# Altium schematic sheet PCB-MAIN_08_STORAGE_SENSORS.SchDoc
size 594 x 420 mm
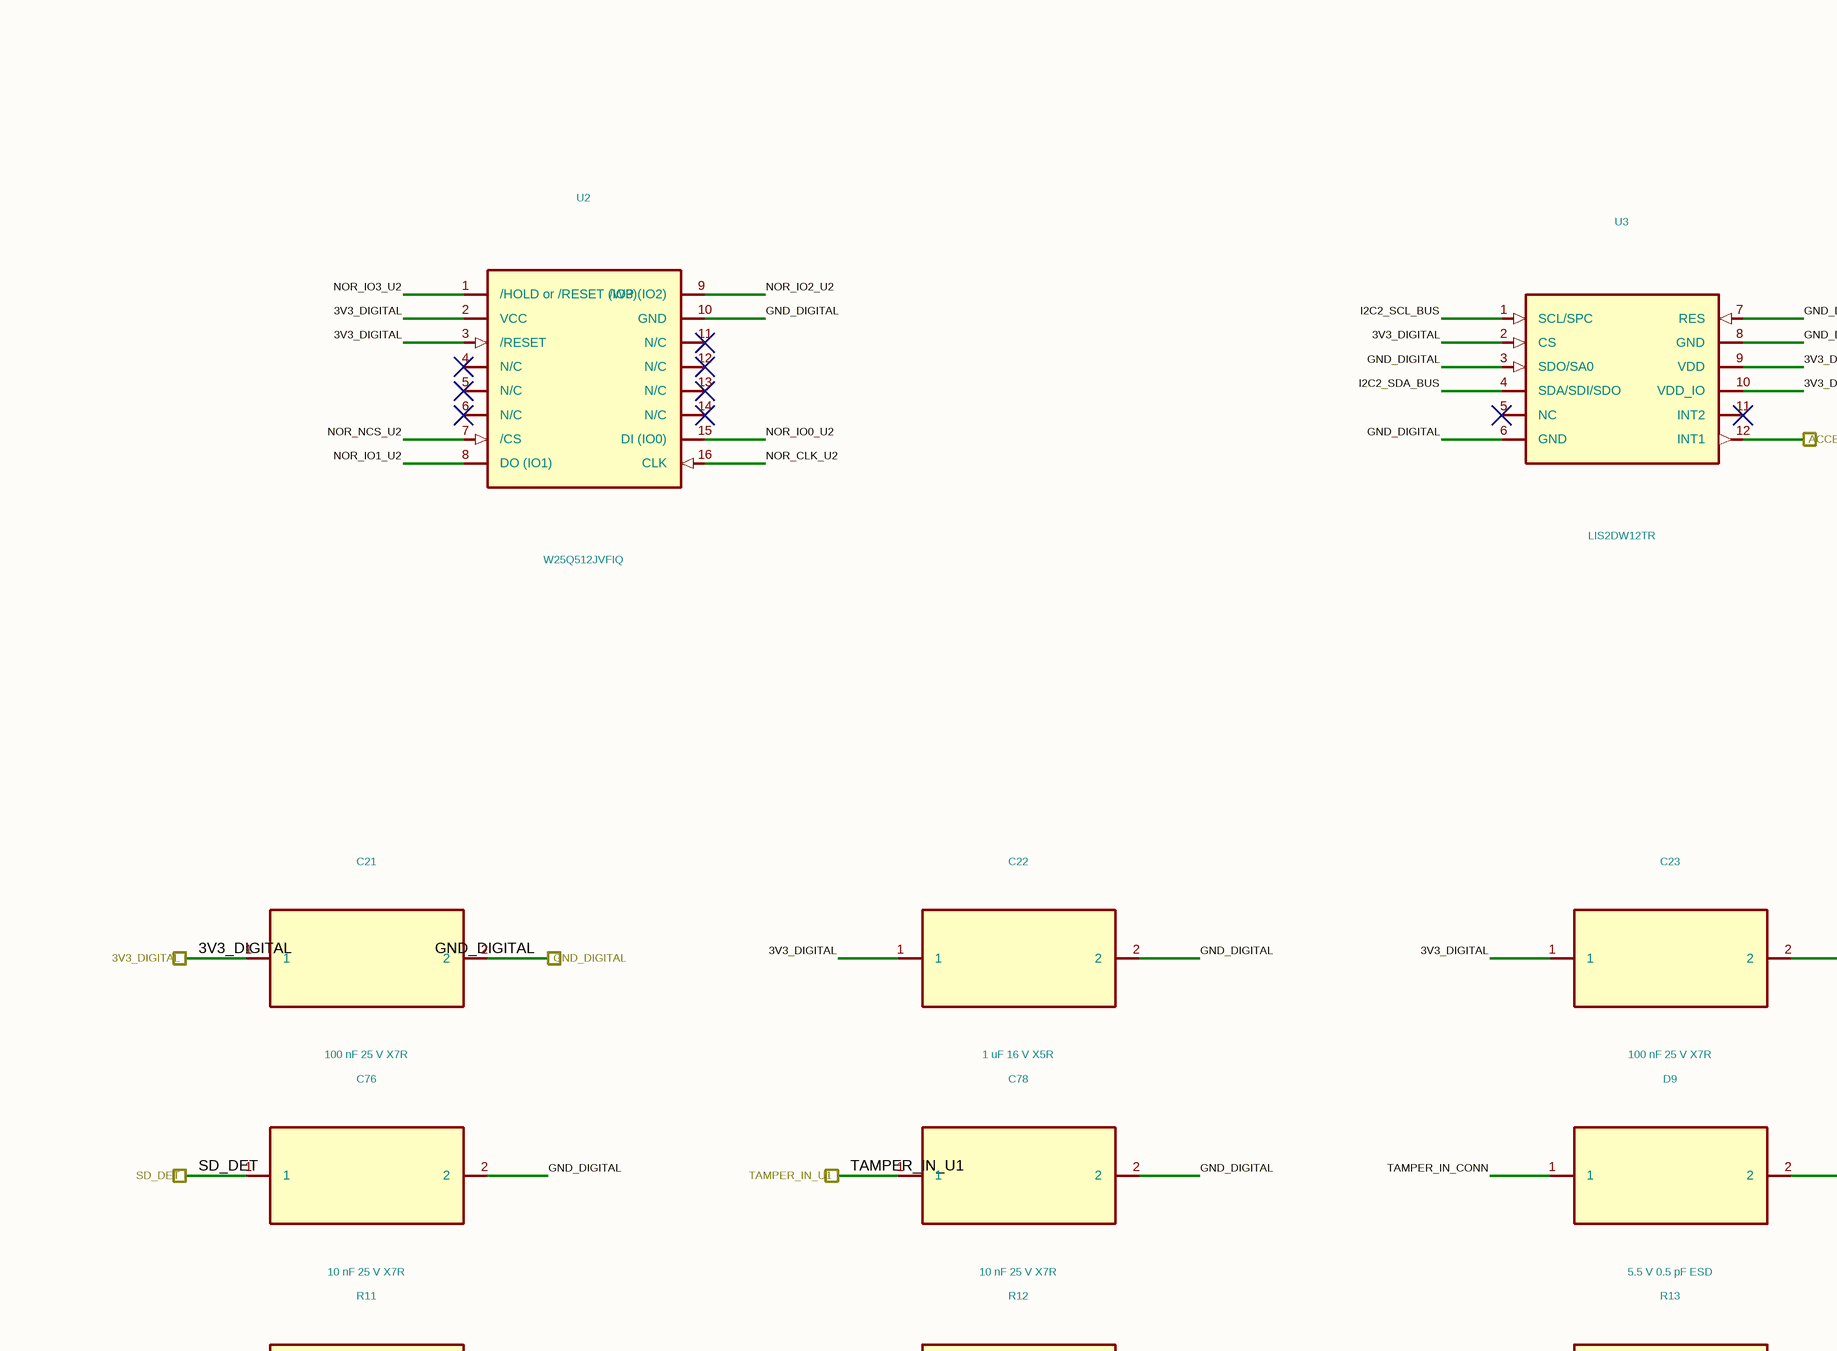
[diagram p0: PCB-MAIN_08_STORAGE_SENSORS.SchDoc, top left]
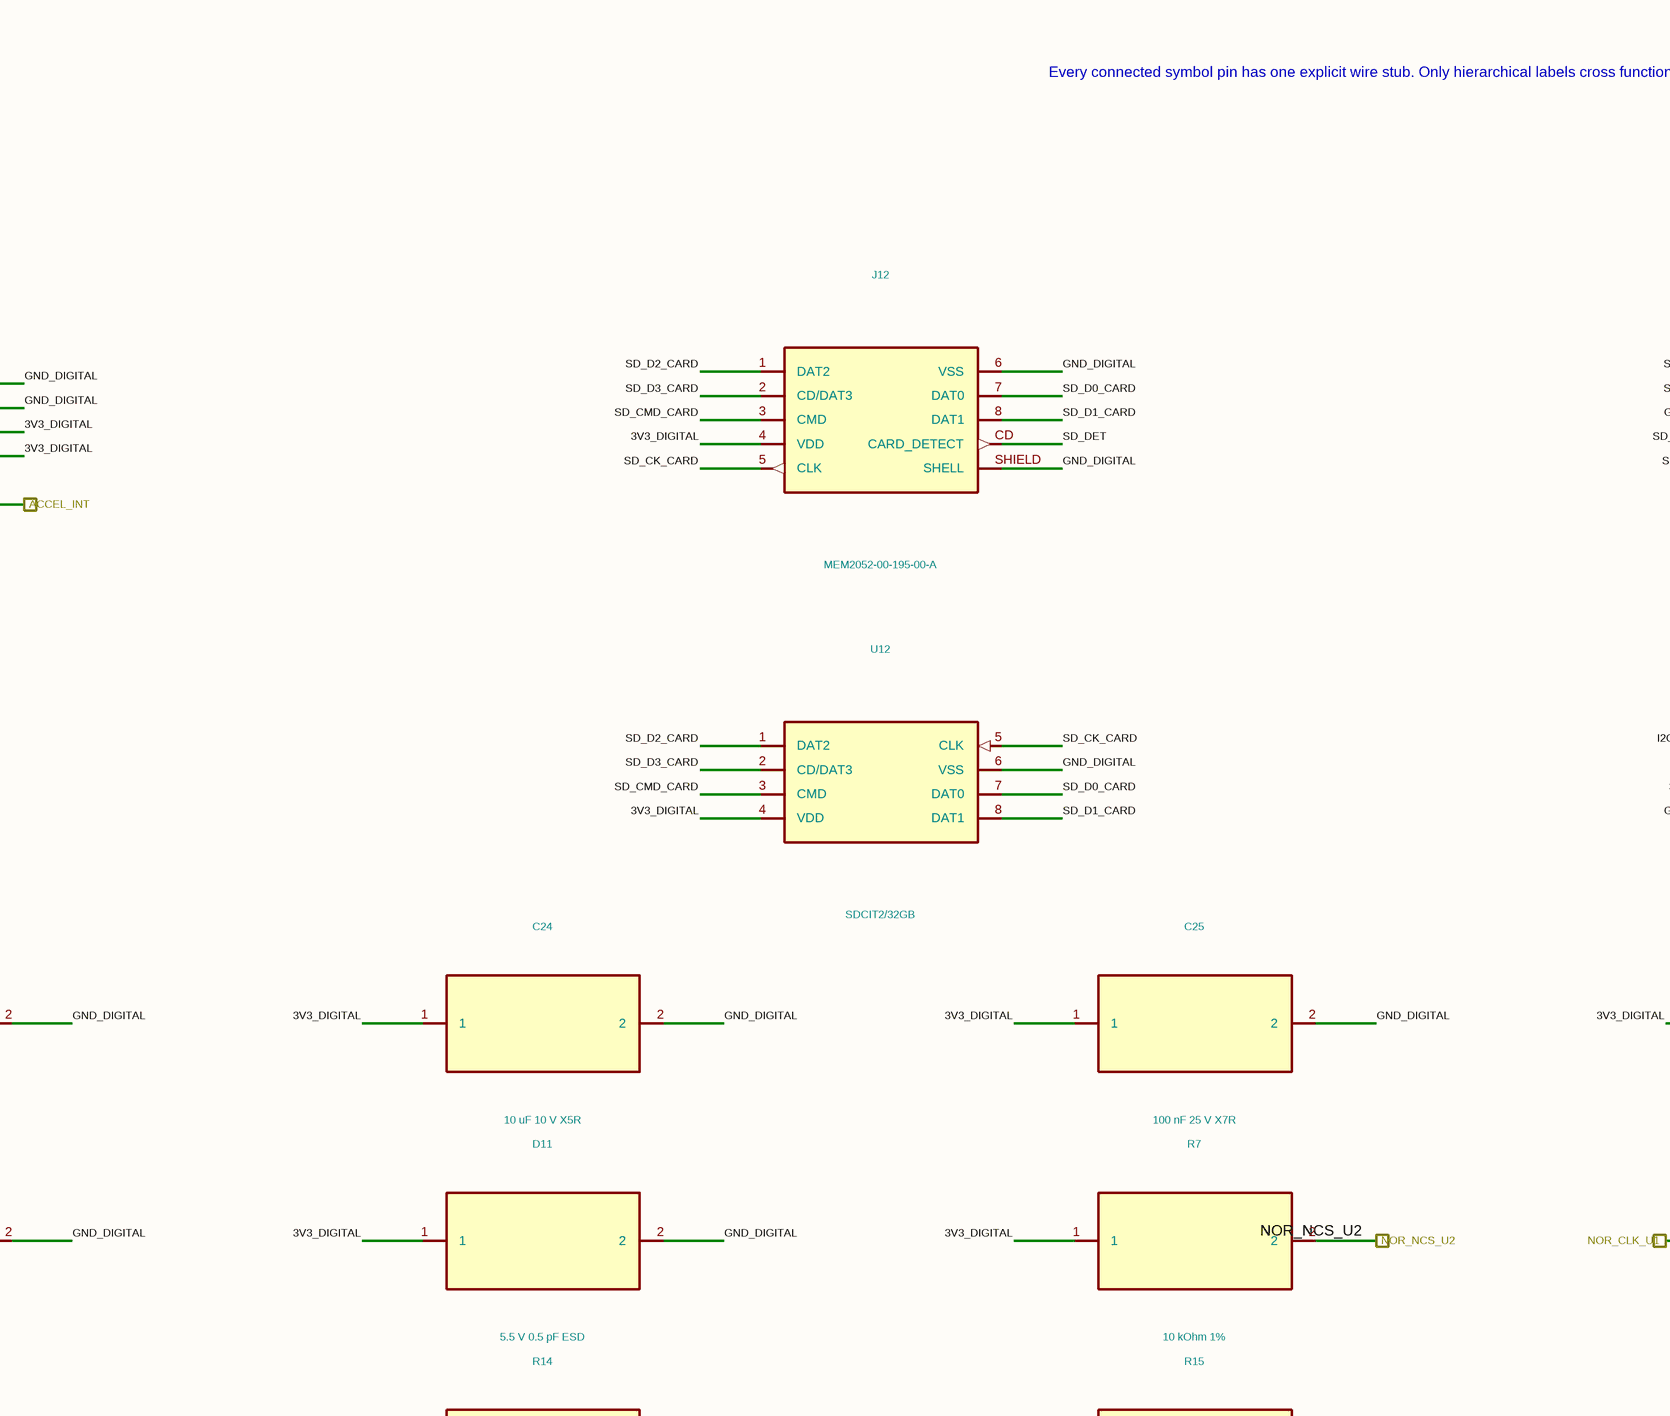
[diagram p1: PCB-MAIN_08_STORAGE_SENSORS.SchDoc, top middle]
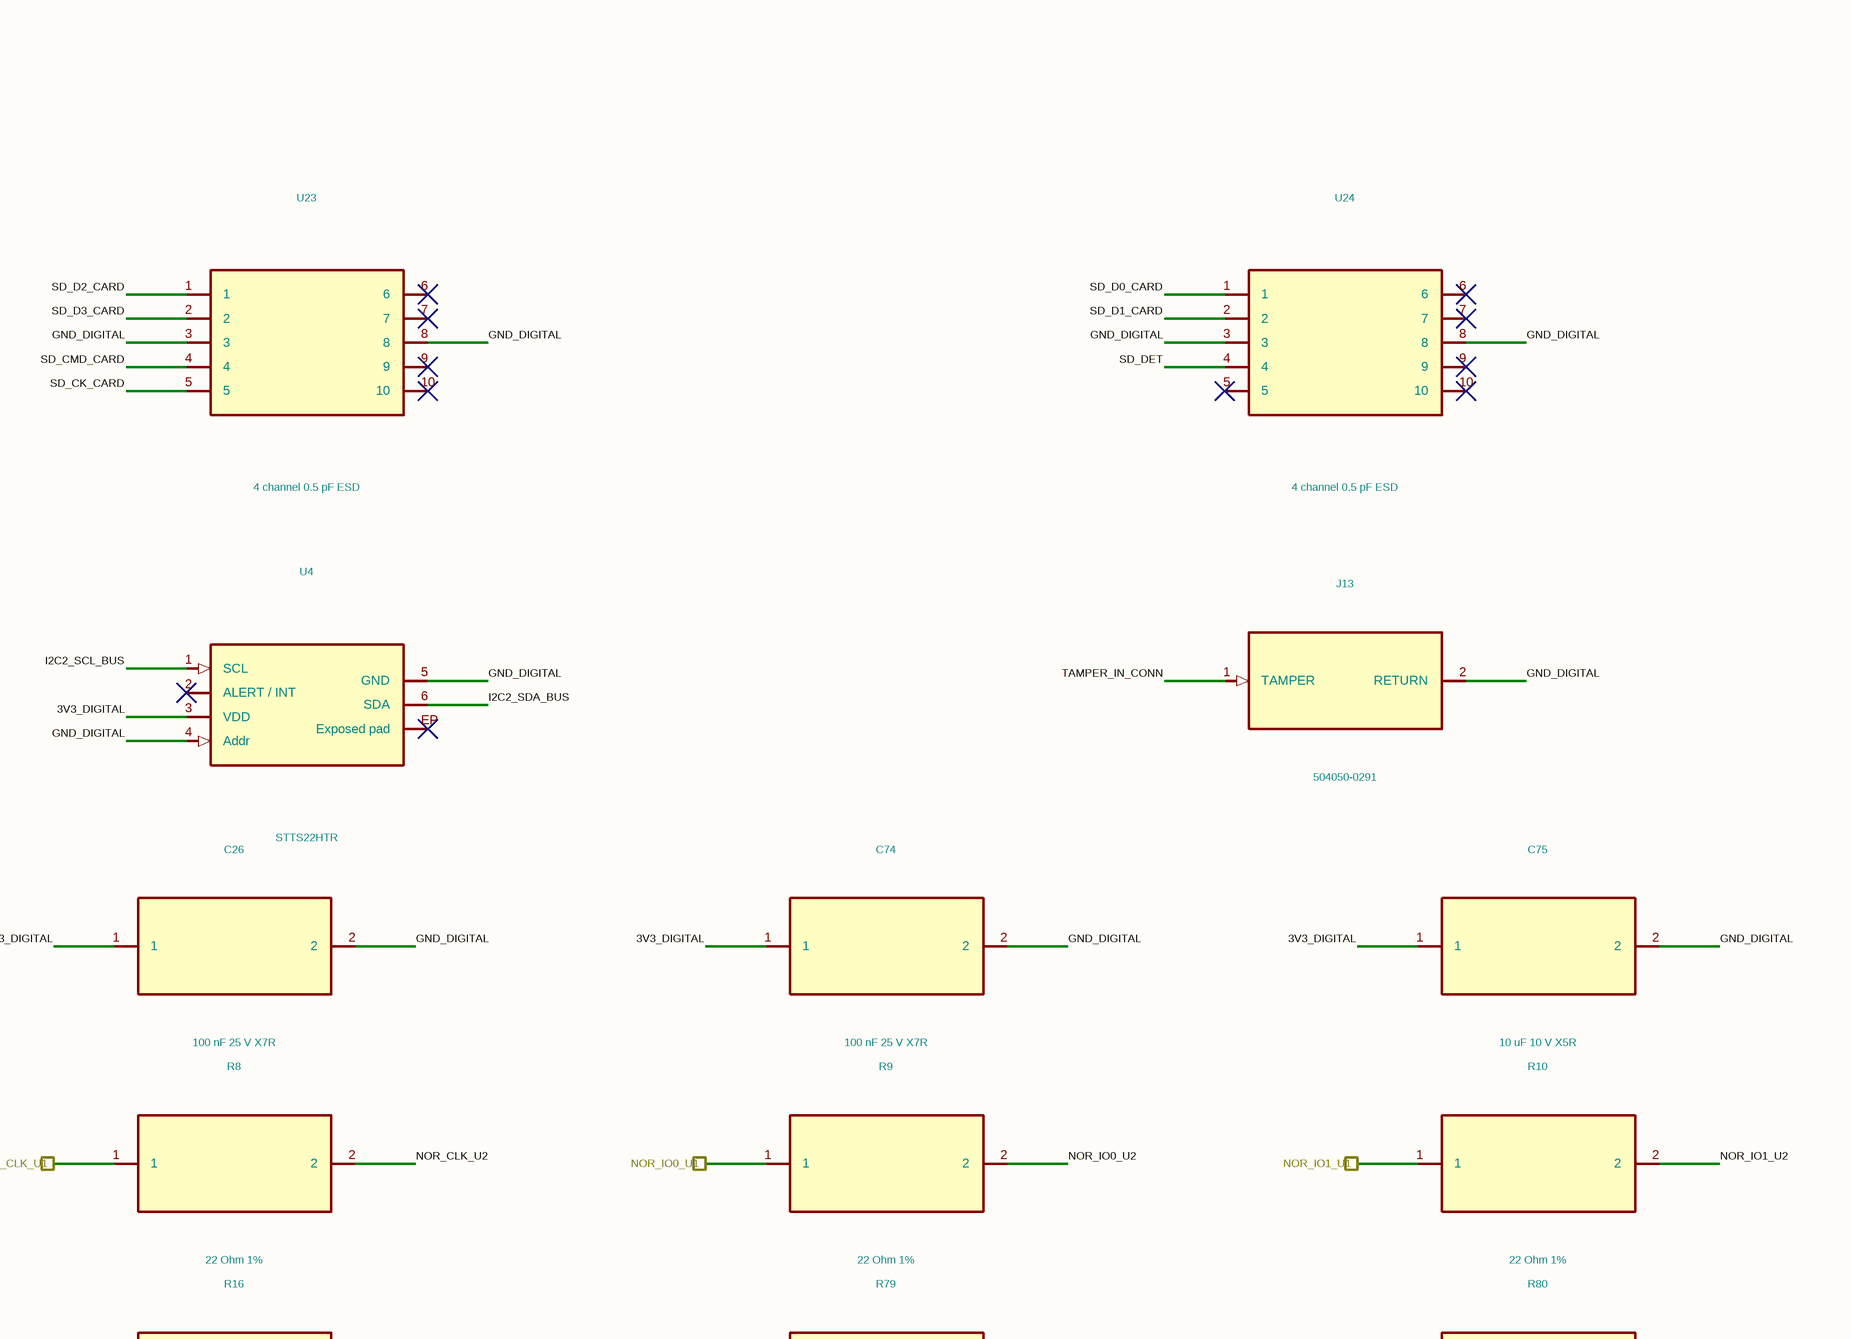
[diagram p2: PCB-MAIN_08_STORAGE_SENSORS.SchDoc, top right]
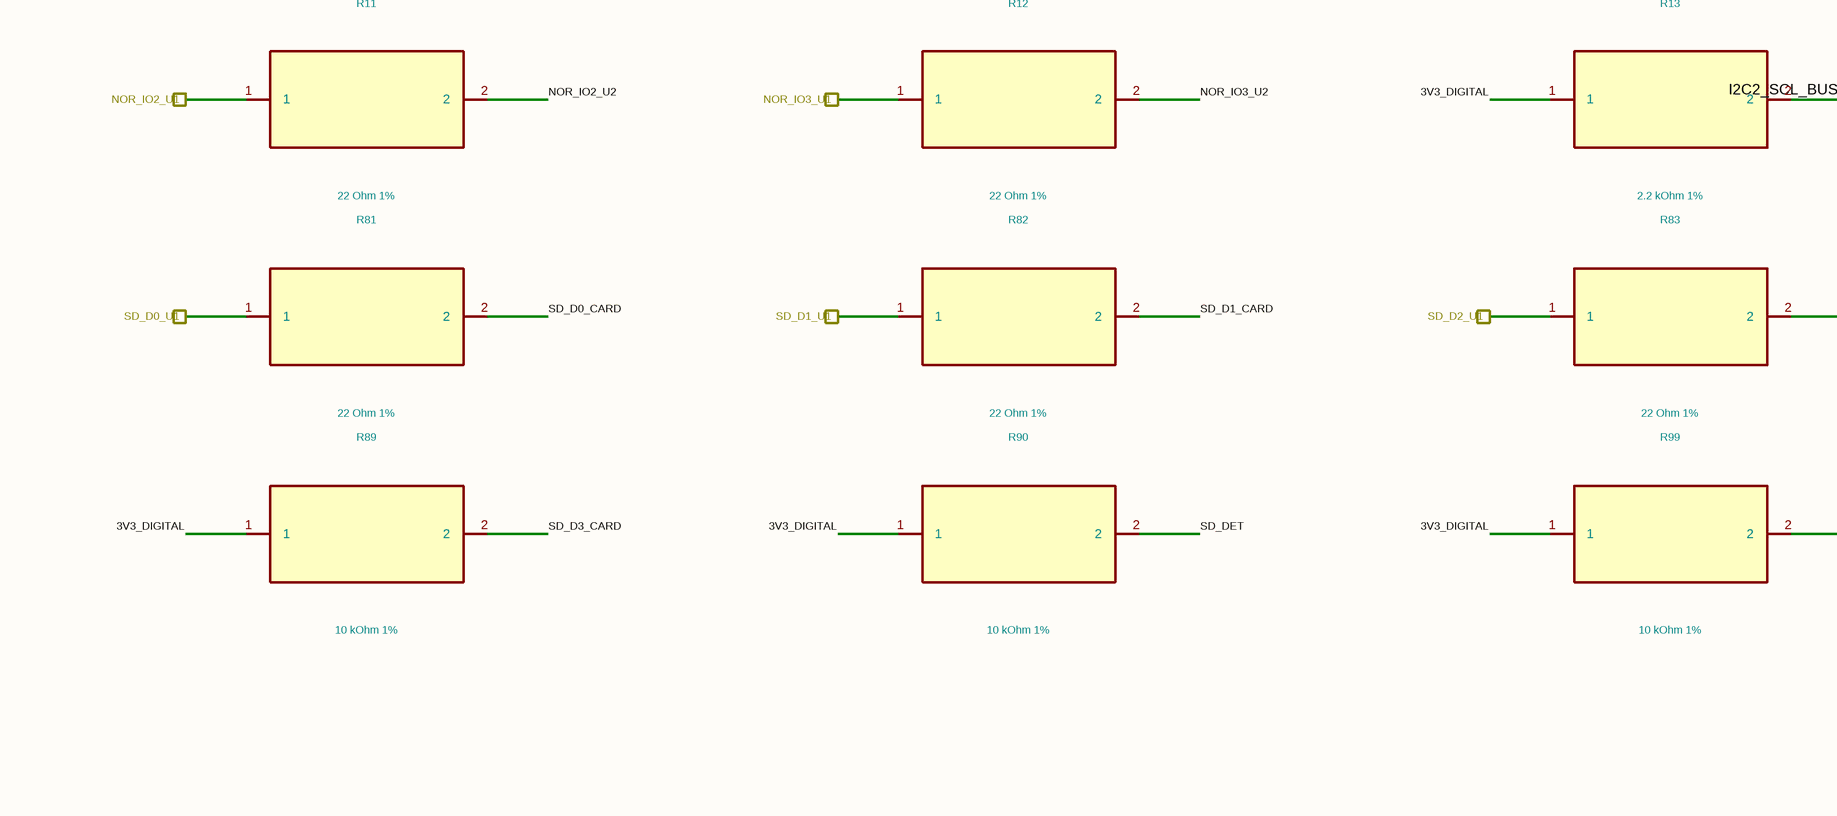
[diagram p3: PCB-MAIN_08_STORAGE_SENSORS.SchDoc, centre left]
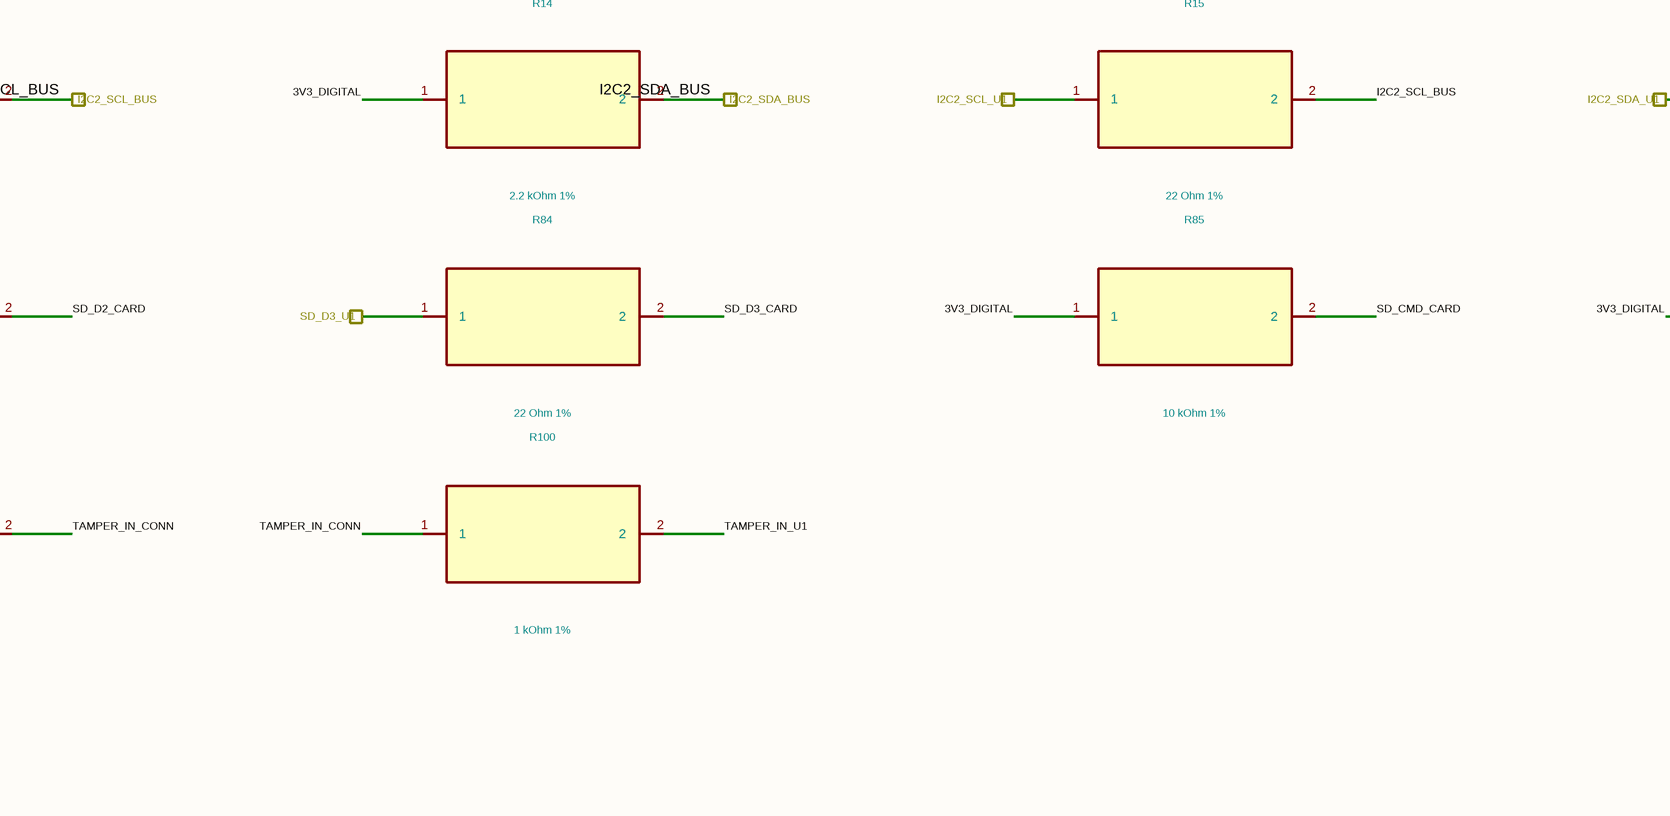
[diagram p4: PCB-MAIN_08_STORAGE_SENSORS.SchDoc, centre middle]
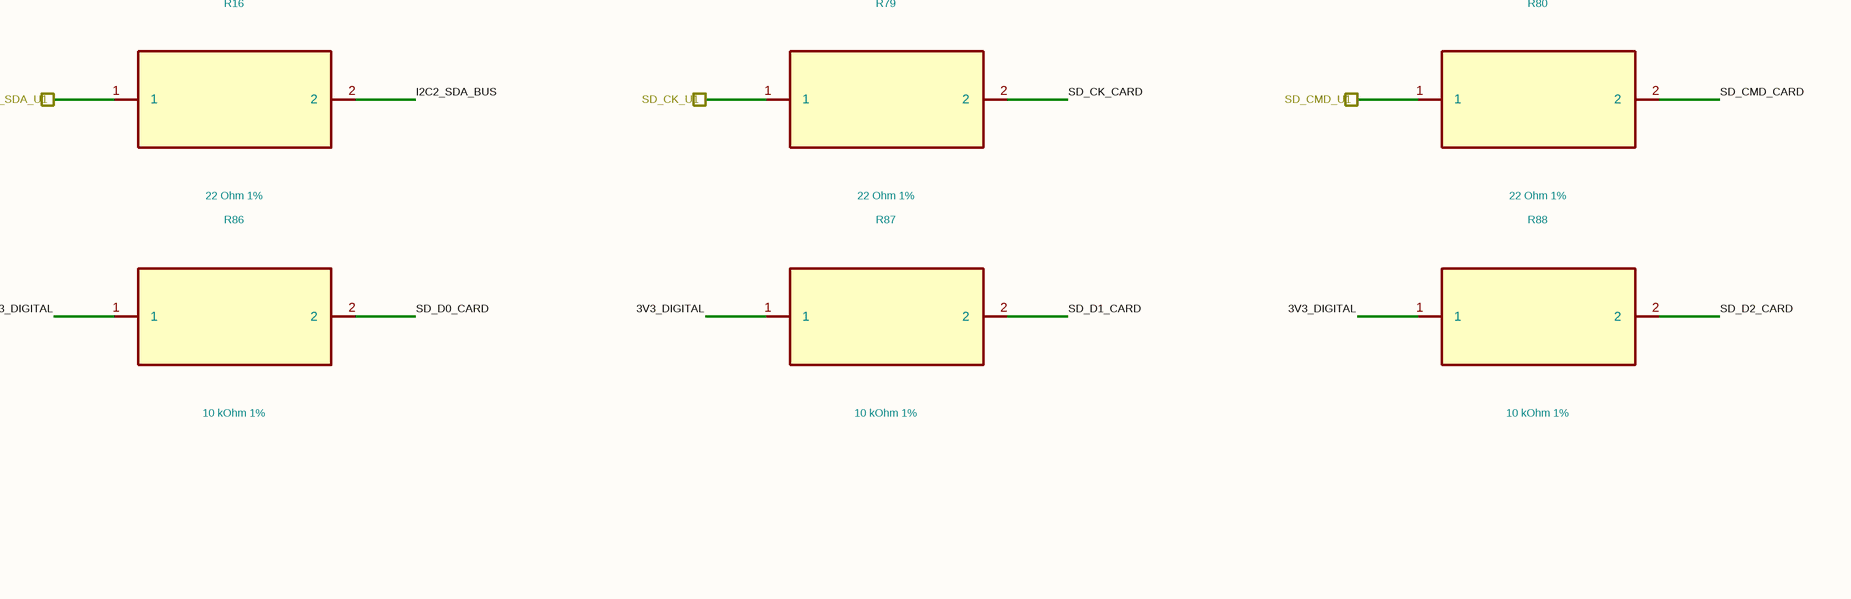
[diagram p5: PCB-MAIN_08_STORAGE_SENSORS.SchDoc, centre right]
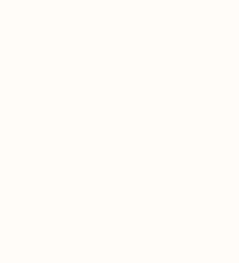
[diagram p6: PCB-MAIN_08_STORAGE_SENSORS.SchDoc, bottom left]

## Parts
C21  100 nF 25 V X7R  [C_0402_1005Metric]
C22  1 uF 16 V X5R  [C_0402_1005Metric]
C23  100 nF 25 V X7R  [C_0402_1005Metric]
C24  10 uF 10 V X5R  [C_0603_1608Metric]
C25  100 nF 25 V X7R  [C_0402_1005Metric]
C26  100 nF 25 V X7R  [C_0402_1005Metric]
C74  100 nF 25 V X7R  [C_0402_1005Metric]
C75  10 uF 10 V X5R  [C_0603_1608Metric]
C76  10 nF 25 V X7R  [C_0402_1005Metric]
C78  10 nF 25 V X7R  [C_0402_1005Metric]
D9  5.5 V 0.5 pF ESD
D11  5.5 V 0.5 pF ESD
J12  MEM2052-00-195-00-A
J13  504050-0291
R7  10 kOhm 1%  [R_0402_1005Metric]
R8  22 Ohm 1%  [R_0402_1005Metric]
R9  22 Ohm 1%  [R_0402_1005Metric]
R10  22 Ohm 1%  [R_0402_1005Metric]
R11  22 Ohm 1%  [R_0402_1005Metric]
R12  22 Ohm 1%  [R_0402_1005Metric]
R13  2.2 kOhm 1%  [R_0402_1005Metric]
R14  2.2 kOhm 1%  [R_0402_1005Metric]
R15  22 Ohm 1%  [R_0402_1005Metric]
R16  22 Ohm 1%  [R_0402_1005Metric]
R79  22 Ohm 1%  [R_0402_1005Metric]
R80  22 Ohm 1%  [R_0402_1005Metric]
R81  22 Ohm 1%  [R_0402_1005Metric]
R82  22 Ohm 1%  [R_0402_1005Metric]
R83  22 Ohm 1%  [R_0402_1005Metric]
R84  22 Ohm 1%  [R_0402_1005Metric]
R85  10 kOhm 1%  [R_0402_1005Metric]
R86  10 kOhm 1%  [R_0402_1005Metric]
R87  10 kOhm 1%  [R_0402_1005Metric]
R88  10 kOhm 1%  [R_0402_1005Metric]
R89  10 kOhm 1%  [R_0402_1005Metric]
R90  10 kOhm 1%  [R_0402_1005Metric]
R99  10 kOhm 1%  [R_0402_1005Metric]
R100  1 kOhm 1%  [R_0402_1005Metric]
U2  W25Q512JVFIQ
U3  LIS2DW12TR
U4  STTS22HTR
U12  SDCIT2/32GB
U23  4 channel 0.5 pF ESD
U24  4 channel 0.5 pF ESD

## Ports
3V3_DIGITAL, ACCEL_INT, GND_DIGITAL, I2C2_SCL_BUS, I2C2_SCL_U1, I2C2_SDA_BUS, I2C2_SDA_U1, NOR_CLK_U1, NOR_IO0_U1, NOR_IO1_U1, NOR_IO2_U1, NOR_IO3_U1, NOR_NCS_U2, SD_CK_U1, SD_CMD_U1, SD_D0_U1, SD_D1_U1, SD_D2_U1, SD_D3_U1, SD_DET, TAMPER_IN_U1

## Nets
3V3_DIGITAL: C21.1 C22.1 C23.1 C24.1 C25.1 C26.1 C74.1 C75.1 D11.1 J12.4(VDD) R7.1 R13.1 R14.1 R85.1 R86.1 R87.1 R88.1 R89.1 R90.1 R99.1 U2.2(VCC) U2.3(/RESET) U3.2(CS) U3.9(VDD) U3.10(VDD_IO) U4.3(VDD) U12.4(VDD) ; port 3V3_DIGITAL
ACCEL_INT: U3.12(INT1) ; port ACCEL_INT
GND_DIGITAL: C21.2 C22.2 C23.2 C24.2 C25.2 C26.2 C74.2 C75.2 C76.2 C78.2 D9.2 D11.2 J12.6(VSS) J12.SHIELD(SHELL) J13.2(RETURN) U2.10(GND) U3.3(SDO/SA0) U3.6(GND) U3.7(RES) U3.8(GND) U4.4(Addr) U4.5(GND) U12.6(VSS) U23.3 U23.8 U24.3 U24.8 ; port GND_DIGITAL
I2C2_SCL_BUS: R13.2 R15.2 U3.1(SCL/SPC) U4.1(SCL) ; port I2C2_SCL_BUS
I2C2_SCL_U1: R15.1 ; port I2C2_SCL_U1
I2C2_SDA_BUS: R14.2 R16.2 U3.4(SDA/SDI/SDO) U4.6(SDA) ; port I2C2_SDA_BUS
I2C2_SDA_U1: R16.1 ; port I2C2_SDA_U1
NOR_CLK_U1: R8.1 ; port NOR_CLK_U1
NOR_CLK_U2: R8.2 U2.16(CLK)
NOR_IO0_U1: R9.1 ; port NOR_IO0_U1
NOR_IO0_U2: R9.2 U2.15(DI_(IO0))
NOR_IO1_U1: R10.1 ; port NOR_IO1_U1
NOR_IO1_U2: R10.2 U2.8(DO_(IO1))
NOR_IO2_U1: R11.1 ; port NOR_IO2_U1
NOR_IO2_U2: R11.2 U2.9(/WP_(IO2))
NOR_IO3_U1: R12.1 ; port NOR_IO3_U1
NOR_IO3_U2: R12.2 U2.1(/HOLD_or_/RESET_(IO3))
NOR_NCS_U2: R7.2 U2.7(/CS) ; port NOR_NCS_U2
SD_CK_CARD: J12.5(CLK) R79.2 U12.5(CLK) U23.5
SD_CK_U1: R79.1 ; port SD_CK_U1
SD_CMD_CARD: J12.3(CMD) R80.2 R85.2 U12.3(CMD) U23.4
SD_CMD_U1: R80.1 ; port SD_CMD_U1
SD_D0_CARD: J12.7(DAT0) R81.2 R86.2 U12.7(DAT0) U24.1
SD_D0_U1: R81.1 ; port SD_D0_U1
SD_D1_CARD: J12.8(DAT1) R82.2 R87.2 U12.8(DAT1) U24.2
SD_D1_U1: R82.1 ; port SD_D1_U1
SD_D2_CARD: J12.1(DAT2) R83.2 R88.2 U12.1(DAT2) U23.1
SD_D2_U1: R83.1 ; port SD_D2_U1
SD_D3_CARD: J12.2(CD/DAT3) R84.2 R89.2 U12.2(CD/DAT3) U23.2
SD_D3_U1: R84.1 ; port SD_D3_U1
SD_DET: C76.1 J12.CD(CARD_DETECT) R90.2 U24.4 ; port SD_DET
TAMPER_IN_CONN: D9.1 J13.1(TAMPER) R99.2 R100.1
TAMPER_IN_U1: C78.1 R100.2 ; port TAMPER_IN_U1

Not connected (* = marked no-connect by the designer): U2 4(N/C)* 5(N/C)* 6(N/C)* 11(N/C)* 12(N/C)* 13(N/C)* 14(N/C)*; U3 5(NC)* 11(INT2)*; U4 2(ALERT_/_INT)* EP(Exposed_pad)*; U23 6* 7* 9* 10*; U24 5* 6* 7* 9* 10*

## Notes on the sheet
- Every connected symbol pin has one explicit wire stub. Only hierarchical labels cross functional-sheet boundaries.
- 1
- 2
- 3
- 4
- 5
- 6
- 7
- 8
- 9
- 10
- 11
- A
- B
- C
- D
- E
- F
- G
- H
- Human-readable hierarchy candidate; exact Review-A pin/net equivalence enforced
- Functional sheet 9 of 10
- NOT FOR MANUFACTURE - hierarchy review/routing/DRC/DFM/Review B pending
- Title: Dioneya PCB-MAIN Rev.A - Storage + sensors
- File: PCB-MAIN_08_STORAGE_SENSORS.kicad_sch
- Sheet: /
- Dioneya / ZS-BPLA
- KiCad E.D.A.  kicad (5.1.4)-1
- Size: A2
- Date: 2026-09-16
- Rev: A
- Id: 1/1

## Library data of the parts
C21 = C21_GRM155R71E104KE14D: Manufacturer: Murata; Population: FITTED; Authority: Winbond_W25Q512JV_RevB; MPN: GRM155R71E104KE14D; Package: 0402; Value: 100 nF 25 V X7R; Footprint: Capacitor_SMD:C_0402_1005Metric
C22 = C22_GRM155R61C105KA12D: Manufacturer: Murata; Population: FITTED; Authority: Winbond_W25Q512JV_RevB; MPN: GRM155R61C105KA12D; Package: 0402; Value: 1 uF 16 V X5R; Footprint: Capacitor_SMD:C_0402_1005Metric
C23 = C23_GRM155R71E104KE14D: Manufacturer: Murata; Population: FITTED; Authority: ST_LIS2DW12_DS11811_Rev9; MPN: GRM155R71E104KE14D; Package: 0402; Value: 100 nF 25 V X7R; Footprint: Capacitor_SMD:C_0402_1005Metric
C24 = C24_GRM188R61A106KE69D: Manufacturer: Murata; Population: FITTED; Authority: ST_LIS2DW12_DS11811_Rev9; MPN: GRM188R61A106KE69D; Package: 0603; Value: 10 uF 10 V X5R; Footprint: Capacitor_SMD:C_0603_1608Metric
C25 = C25_GRM155R71E104KE14D: Manufacturer: Murata; Population: FITTED; Authority: ST_LIS2DW12_DS11811_Rev9; MPN: GRM155R71E104KE14D; Package: 0402; Value: 100 nF 25 V X7R; Footprint: Capacitor_SMD:C_0402_1005Metric
C26 = C26_GRM155R71E104KE14D: Manufacturer: Murata; Population: FITTED; Authority: ST_STTS22H_DS12606_Rev8; MPN: GRM155R71E104KE14D; Package: 0402; Value: 100 nF 25 V X7R; Footprint: Capacitor_SMD:C_0402_1005Metric
C74 = C74_GRM155R71E104KE14D: Manufacturer: Murata; Population: FITTED; Authority: SD_Association_microSD; MPN: GRM155R71E104KE14D; Package: 0402; Value: 100 nF 25 V X7R; Footprint: Capacitor_SMD:C_0402_1005Metric
C75 = C75_GRM188R61A106KE69D: Manufacturer: Murata; Population: FITTED; Authority: SD_Association_microSD; MPN: GRM188R61A106KE69D; Package: 0603; Value: 10 uF 10 V X5R; Footprint: Capacitor_SMD:C_0603_1608Metric
C76 = C76_GRM155R71E103KA01D: Manufacturer: Murata; Population: FITTED; Authority: GCT_MEM2052_official_product_data; MPN: GRM155R71E103KA01D; Package: 0402; Value: 10 nF 25 V X7R; Footprint: Capacitor_SMD:C_0402_1005Metric
C78 = C78_GRM155R71E103KA01D: Manufacturer: Murata; Population: FITTED; Authority: PROJECT_MAIN_AUTH_010; MPN: GRM155R71E103KA01D; Package: 0402; Value: 10 nF 25 V X7R; Footprint: Capacitor_SMD:C_0402_1005Metric
D9 = D9_TPD1E05U06DYAR: Manufacturer: Texas Instruments; Population: FITTED; Authority: TI_TPDxE05U06_RevO; MPN: TPD1E05U06DYAR; Package: SOD-523_DYA; Value: 5.5 V 0.5 pF ESD
D11 = D11_TPD1E05U06DYAR: Manufacturer: Texas Instruments; Population: FITTED; Authority: TI_TPDxE05U06_RevO; MPN: TPD1E05U06DYAR; Package: SOD-523_DYA; Value: 5.5 V 0.5 pF ESD
J12 = J12_MEM2052-00-195-00-A: Manufacturer: CONTROLLED_AUTHORITY; Population: FITTED; Authority: PCB_MAIN_CONNECTOR_FIXTURE_PIN_AUTHORITY_REV_A.csv; MPN: MEM2052-00-195-00-A; Package: microSD_push-push_1.95mm_8P_CD; Value: MEM2052-00-195-00-A
J13 = J13_504050-0291: Manufacturer: CONTROLLED_AUTHORITY; Population: FITTED; Authority: PCB_MAIN_CONNECTOR_FIXTURE_PIN_AUTHORITY_REV_A.csv; MPN: 504050-0291; Package: Pico-Lock_1.5mm_2P_RA_SMT; Value: 504050-0291
R7 = R7_ERJ-2RKF1002X: Manufacturer: Panasonic; Population: FITTED; Authority: Winbond_W25Q512JV_RevB; MPN: ERJ-2RKF1002X; Package: 0402; Value: 10 kOhm 1%; Footprint: Resistor_SMD:R_0402_1005Metric
R8 = R8_ERJ-2RKF22R0X: Manufacturer: Panasonic; Population: FITTED; Authority: PROJECT_MAIN_AUTH_010; MPN: ERJ-2RKF22R0X; Package: 0402; Value: 22 Ohm 1%; Footprint: Resistor_SMD:R_0402_1005Metric
R9 = R9_ERJ-2RKF22R0X: Manufacturer: Panasonic; Population: FITTED; Authority: PROJECT_MAIN_AUTH_010; MPN: ERJ-2RKF22R0X; Package: 0402; Value: 22 Ohm 1%; Footprint: Resistor_SMD:R_0402_1005Metric
R10 = R10_ERJ-2RKF22R0X: Manufacturer: Panasonic; Population: FITTED; Authority: PROJECT_MAIN_AUTH_010; MPN: ERJ-2RKF22R0X; Package: 0402; Value: 22 Ohm 1%; Footprint: Resistor_SMD:R_0402_1005Metric
R11 = R11_ERJ-2RKF22R0X: Manufacturer: Panasonic; Population: FITTED; Authority: PROJECT_MAIN_AUTH_010; MPN: ERJ-2RKF22R0X; Package: 0402; Value: 22 Ohm 1%; Footprint: Resistor_SMD:R_0402_1005Metric
R12 = R12_ERJ-2RKF22R0X: Manufacturer: Panasonic; Population: FITTED; Authority: PROJECT_MAIN_AUTH_010; MPN: ERJ-2RKF22R0X; Package: 0402; Value: 22 Ohm 1%; Footprint: Resistor_SMD:R_0402_1005Metric
R13 = R13_ERJ-2RKF2201X: Manufacturer: Panasonic; Population: FITTED; Authority: I2C_UM10204; MPN: ERJ-2RKF2201X; Package: 0402; Value: 2.2 kOhm 1%; Footprint: Resistor_SMD:R_0402_1005Metric
R14 = R14_ERJ-2RKF2201X: Manufacturer: Panasonic; Population: FITTED; Authority: I2C_UM10204; MPN: ERJ-2RKF2201X; Package: 0402; Value: 2.2 kOhm 1%; Footprint: Resistor_SMD:R_0402_1005Metric
R15 = R15_ERJ-2RKF22R0X: Manufacturer: Panasonic; Population: FITTED; Authority: PROJECT_MAIN_AUTH_010; MPN: ERJ-2RKF22R0X; Package: 0402; Value: 22 Ohm 1%; Footprint: Resistor_SMD:R_0402_1005Metric
R16 = R16_ERJ-2RKF22R0X: Manufacturer: Panasonic; Population: FITTED; Authority: PROJECT_MAIN_AUTH_010; MPN: ERJ-2RKF22R0X; Package: 0402; Value: 22 Ohm 1%; Footprint: Resistor_SMD:R_0402_1005Metric
R79 = R79_ERJ-2RKF22R0X: Manufacturer: Panasonic; Population: FITTED; Authority: SD_Association_microSD; MPN: ERJ-2RKF22R0X; Package: 0402; Value: 22 Ohm 1%; Footprint: Resistor_SMD:R_0402_1005Metric
R80 = R80_ERJ-2RKF22R0X: Manufacturer: Panasonic; Population: FITTED; Authority: SD_Association_microSD; MPN: ERJ-2RKF22R0X; Package: 0402; Value: 22 Ohm 1%; Footprint: Resistor_SMD:R_0402_1005Metric
R81 = R81_ERJ-2RKF22R0X: Manufacturer: Panasonic; Population: FITTED; Authority: SD_Association_microSD; MPN: ERJ-2RKF22R0X; Package: 0402; Value: 22 Ohm 1%; Footprint: Resistor_SMD:R_0402_1005Metric
R82 = R82_ERJ-2RKF22R0X: Manufacturer: Panasonic; Population: FITTED; Authority: SD_Association_microSD; MPN: ERJ-2RKF22R0X; Package: 0402; Value: 22 Ohm 1%; Footprint: Resistor_SMD:R_0402_1005Metric
R83 = R83_ERJ-2RKF22R0X: Manufacturer: Panasonic; Population: FITTED; Authority: SD_Association_microSD; MPN: ERJ-2RKF22R0X; Package: 0402; Value: 22 Ohm 1%; Footprint: Resistor_SMD:R_0402_1005Metric
R84 = R84_ERJ-2RKF22R0X: Manufacturer: Panasonic; Population: FITTED; Authority: SD_Association_microSD; MPN: ERJ-2RKF22R0X; Package: 0402; Value: 22 Ohm 1%; Footprint: Resistor_SMD:R_0402_1005Metric
R85 = R85_ERJ-2RKF1002X: Manufacturer: Panasonic; Population: FITTED; Authority: SD_Association_microSD; MPN: ERJ-2RKF1002X; Package: 0402; Value: 10 kOhm 1%; Footprint: Resistor_SMD:R_0402_1005Metric
R86 = R86_ERJ-2RKF1002X: Manufacturer: Panasonic; Population: FITTED; Authority: SD_Association_microSD; MPN: ERJ-2RKF1002X; Package: 0402; Value: 10 kOhm 1%; Footprint: Resistor_SMD:R_0402_1005Metric
R87 = R87_ERJ-2RKF1002X: Manufacturer: Panasonic; Population: FITTED; Authority: SD_Association_microSD; MPN: ERJ-2RKF1002X; Package: 0402; Value: 10 kOhm 1%; Footprint: Resistor_SMD:R_0402_1005Metric
R88 = R88_ERJ-2RKF1002X: Manufacturer: Panasonic; Population: FITTED; Authority: SD_Association_microSD; MPN: ERJ-2RKF1002X; Package: 0402; Value: 10 kOhm 1%; Footprint: Resistor_SMD:R_0402_1005Metric
R89 = R89_ERJ-2RKF1002X: Manufacturer: Panasonic; Population: FITTED; Authority: SD_Association_microSD; MPN: ERJ-2RKF1002X; Package: 0402; Value: 10 kOhm 1%; Footprint: Resistor_SMD:R_0402_1005Metric
R90 = R90_ERJ-2RKF1002X: Manufacturer: Panasonic; Population: FITTED; Authority: GCT_MEM2052_official_product_data; MPN: ERJ-2RKF1002X; Package: 0402; Value: 10 kOhm 1%; Footprint: Resistor_SMD:R_0402_1005Metric
R99 = R99_ERJ-2RKF1002X: Manufacturer: Panasonic; Population: FITTED; Authority: PROJECT_MAIN_AUTH_010; MPN: ERJ-2RKF1002X; Package: 0402; Value: 10 kOhm 1%; Footprint: Resistor_SMD:R_0402_1005Metric
R100 = R100_ERJ-2RKF1001X: Manufacturer: Panasonic; Population: FITTED; Authority: PROJECT_MAIN_AUTH_010; MPN: ERJ-2RKF1001X; Package: 0402; Value: 1 kOhm 1%; Footprint: Resistor_SMD:R_0402_1005Metric
U2 = U2_W25Q512JVFIQ: Manufacturer: Winbond; Population: FITTED; Authority: PCB_MAIN_STORAGE_SENSOR_PIN_AUTHORITY_REV_A.csv; MPN: W25Q512JVFIQ; Package: SOIC-16_300mil_F; Value: W25Q512JVFIQ
U3 = U3_LIS2DW12TR: Manufacturer: STMicroelectronics; Population: FITTED; Authority: PCB_MAIN_STORAGE_SENSOR_PIN_AUTHORITY_REV_A.csv; MPN: LIS2DW12TR; Package: LGA-12_2x2mm; Value: LIS2DW12TR
U4 = U4_STTS22HTR: Manufacturer: STMicroelectronics; Population: FITTED; Authority: PCB_MAIN_STORAGE_SENSOR_PIN_AUTHORITY_REV_A.csv; MPN: STTS22HTR; Package: UDFN-6L_2x2mm; Value: STTS22HTR
U12 = U12_SDCIT2_32GB: Manufacturer: Kingston; Population: FITTED; Authority: PCB_MAIN_CONNECTOR_FIXTURE_PIN_AUTHORITY_REV_A.csv; MPN: SDCIT2/32GB; Package: microSD_card_8_contact; Value: SDCIT2/32GB
U23 = U23_TPD4E05U06DQAR: Manufacturer: Texas Instruments; Population: FITTED; Authority: TI_TPDxE05U06_RevO; MPN: TPD4E05U06DQAR; Package: USON-10_DQA; Value: 4 channel 0.5 pF ESD
U24 = U24_TPD4E05U06DQAR: Manufacturer: Texas Instruments; Population: FITTED; Authority: TI_TPDxE05U06_RevO; MPN: TPD4E05U06DQAR; Package: USON-10_DQA; Value: 4 channel 0.5 pF ESD